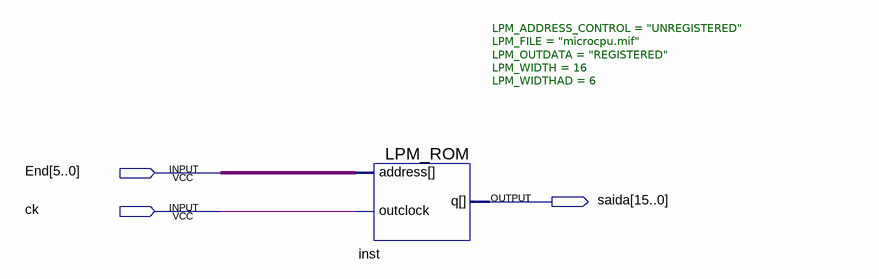
[diagram p0: schematic sheet]
// Quartus schematic memoria.bdf as structural Verilog: 1 symbols, 3 pins
module memoria (
  input  [5:0] End,
  input  ck,
  output [15:0] saida
);

  LPM_ROM #(.LPM_ADDRESS_CONTROL("UNREGISTERED"), .LPM_FILE("microcpu.mif"), .LPM_OUTDATA("REGISTERED"), .LPM_WIDTH(16), .LPM_WIDTHAD(6)) inst (
    .address(End), .outclock(ck), .q(saida));
endmodule
